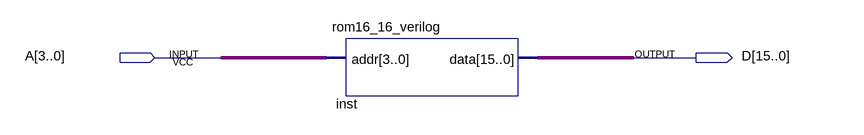
[diagram p0: schematic sheet]
// Quartus schematic test_rom.bdf as structural Verilog: 1 symbols, 2 pins
module test_rom (
  input  [3:0] A,
  output [15:0] D
);

  rom16_16_verilog inst (.addr(A), .data(D));
endmodule
